# Altium schematic sheet Interface_Conn2_Carrier_Board.SchDoc: Connector - Carrier J5 DF17 60-pin (Payload I/O)
size A3; ApprovedBy: Weymen Koo; CheckedBy: -; DrawnBy: Weymen Koo; DocumentNumber: UBCAD-FCSOM-SCH; Revision: A; SheetNumber: 18; SheetTotal: 18; ProjectTitle: Flight Controller SoM; Status: PRELIMINARY; ReleaseDate: 2026-11-14
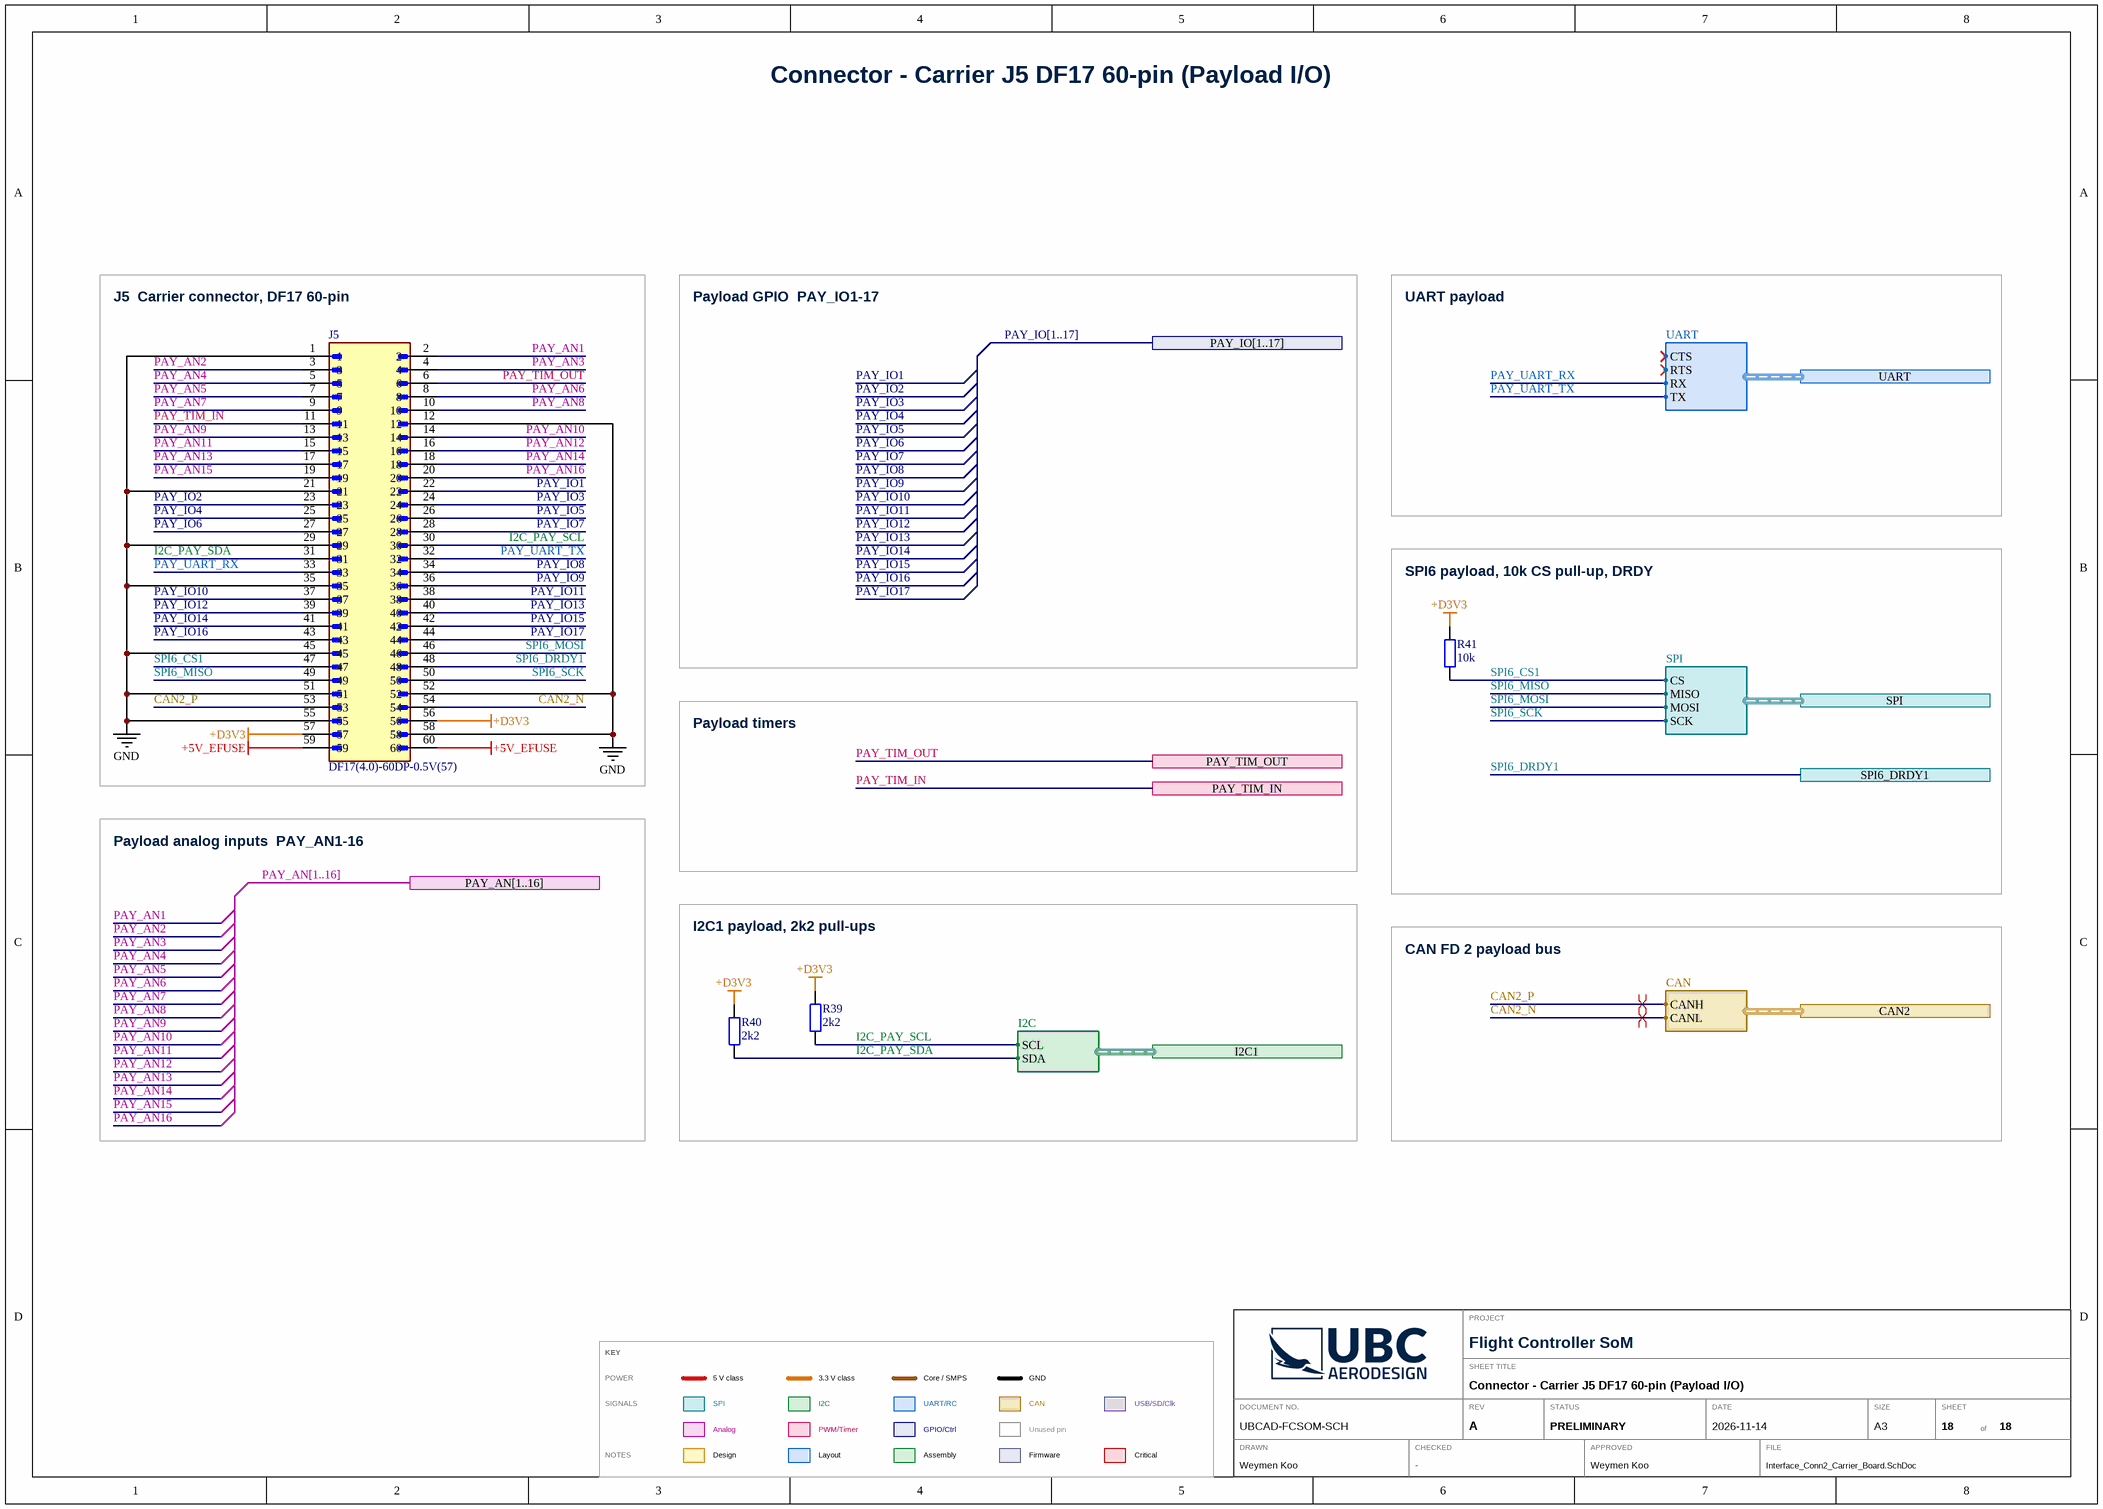
[diagram p0: Interface_Conn2_Carrier_Board.SchDoc]

## Parts
J5  DF17(4.0)-60DP-0.5V(57)  [HRS_DF17(4.0)-60DP-0.5V(57)]
R39  2k2  [IPC C R0402 NO SILK]
R40  2k2  [IPC C R0402 NO SILK]
R41  10k  [IPC C R0402 NO SILK]

## Blocks framed on the sheet
J5  Carrier connector, DF17 60-pin: J5
SPI6 payload, 10k CS pull-up, DRDY: R41
I2C1 payload, 2k2 pull-ups: R39 R40

## Ports
CAN2 (harness CAN, see 1[7A], 14[7B]), I2C1 (harness I2C, see 1[7C], 4[0@]), PAY_AN[1..16] (see 1[7C], 4[7B]), PAY_IO[1..17] (see 1[7C], 4[5B]), PAY_TIM_IN (see 1[7C], 4[9@]), PAY_TIM_OUT (see 1[7C], 4[9@]), SPI6_DRDY1 (see 1[7C], 4[7D]), SPI (harness SPI, see 1[7C], 4[8D]), UART (harness UART, see 1[7C], 4[8C])

## Harnesses
CAN: CANH, CANL
I2C: SCL, SDA
SPI: CS, MISO, MOSI, SCK
UART: CTS, RTS, RX, TX

## Nets
+5V_EFUSE: J5.59 J5.60
+D3V3: J5.56 J5.57 R39.2 R40.2 R41.2
GND: J5.1 J5.12 J5.21 J5.29 J5.35 J5.45 J5.51 J5.52 J5.55 J5.58
CAN2_N: J5.54 ; port CAN2.CANL
CAN2_P: J5.53 ; port CAN2.CANH
I2C_PAY_SCL: J5.30 R39.1 ; port I2C1.SCL
I2C_PAY_SDA: J5.31 R40.1 ; port I2C1.SDA
PAY_AN1: J5.2
PAY_AN2: J5.3
PAY_AN3: J5.4
PAY_AN4: J5.5
PAY_AN5: J5.7
PAY_AN6: J5.8
PAY_AN7: J5.9
PAY_AN8: J5.10
PAY_AN9: J5.13
PAY_AN10: J5.14
PAY_AN11: J5.15
PAY_AN12: J5.16
PAY_AN13: J5.17
PAY_AN14: J5.18
PAY_AN15: J5.19
PAY_AN16: J5.20
PAY_IO1: J5.22
PAY_IO2: J5.23
PAY_IO3: J5.24
PAY_IO4: J5.25
PAY_IO5: J5.26
PAY_IO6: J5.27
PAY_IO7: J5.28
PAY_IO8: J5.34
PAY_IO9: J5.36
PAY_IO10: J5.37
PAY_IO11: J5.38
PAY_IO12: J5.39
PAY_IO13: J5.40
PAY_IO14: J5.41
PAY_IO15: J5.42
PAY_IO16: J5.43
PAY_IO17: J5.44
PAY_TIM_IN: J5.11 ; port PAY_TIM_IN
PAY_TIM_OUT: J5.6 ; port PAY_TIM_OUT
PAY_UART_RX: J5.33 ; port UART.RX
PAY_UART_TX: J5.32 ; port UART.TX
SPI6_CS1: J5.47 R41.1 ; port SPI.CS
SPI6_DRDY1: J5.48 ; port SPI6_DRDY1
SPI6_MISO: J5.49 ; port SPI.MISO
SPI6_MOSI: J5.46 ; port SPI.MOSI
SPI6_SCK: J5.50 ; port SPI.SCK

## Buses and harness runs
bus PAY_AN[1..16] = port PAY_AN[1..16]
bus PAY_IO[1..17] = port PAY_IO[1..17]

## Layout directives
differential pair: CAN2_N, CAN2_P

## Notes on the sheet
- Payload GPIO  PAY_IO1-17
- UART payload
- Payload timers
- Payload analog inputs  PAY_AN1-16
- CAN FD 2 payload bus
- PROJECT
- KEY
- POWER
- 5 V class
- 3.3 V class
- Core / SMPS
- GND
- SHEET TITLE
- SIGNALS
- NOTES
- SPI
- Analog
- Design
- I2C
- PWM/Timer
- Layout
- UART/RC
- GPIO/Ctrl
- Assembly
- CAN
- Unused pin
- Firmware
- USB/SD/Clk
- Critical
- DRAWN
- DOCUMENT NO.
- CHECKED
- REV
- STATUS
- APPROVED
- DATE
- FILE
- SIZE
- A3
- SHEET
- of

## Library data of the parts
J5 = CMP-003-000030-2: 60 Position Connector Header, Outer Shroud Contacts Surface Mount Gold; MF: Hirose Electric; Component Type: Standard; Package: None; Pin Count: 60; Source: DF17(4.0)-60DP-0.5V(57).SchLib; Design Item ID: DF17(4.0)-60DP-0.5V(57); Check_prices: https://www.snapeda.com/parts/DF17(4.0)-60DP-0.5V(57)/Hirose/view-part/?ref=eda; SnapEDA_Link: https://www.snapeda.com/parts/DF17(4.0)-60DP-0.5V(57)/Hirose/view-part/?ref=snap; Value: *; MP: DF17(4.0)-60DP-0.5V(57)
R39 R40 = CMP-008-000000-2: RES 2k2 1% 1/16W 0402; Manufacturer: UNI-ROYAL; Manufacturer Part Number: 0402WGF2201TCE; Value: 2k2; Source: Schlib1.SchLib; Design Item ID: Generic RES 0402; Package: 0402; Tolerance: 1%; Power: 1/16W; LCSC Part #: C25879
R41 = CMP-008-000000-2: RES 10k 1% 1/16W 0402; Manufacturer: UNI-ROYAL; Manufacturer Part Number: 0402WGF1002TCE; Value: 10k; Source: Schlib1.SchLib; Design Item ID: Generic RES 0402; Package: 0402; Tolerance: 1%; Power: 1/16W; LCSC Part #: C25744